# Altium schematic sheet BOARD_ADS _V2.0 (1).SchDoc
size A3; SheetNumber: 1; SheetTotal: 1
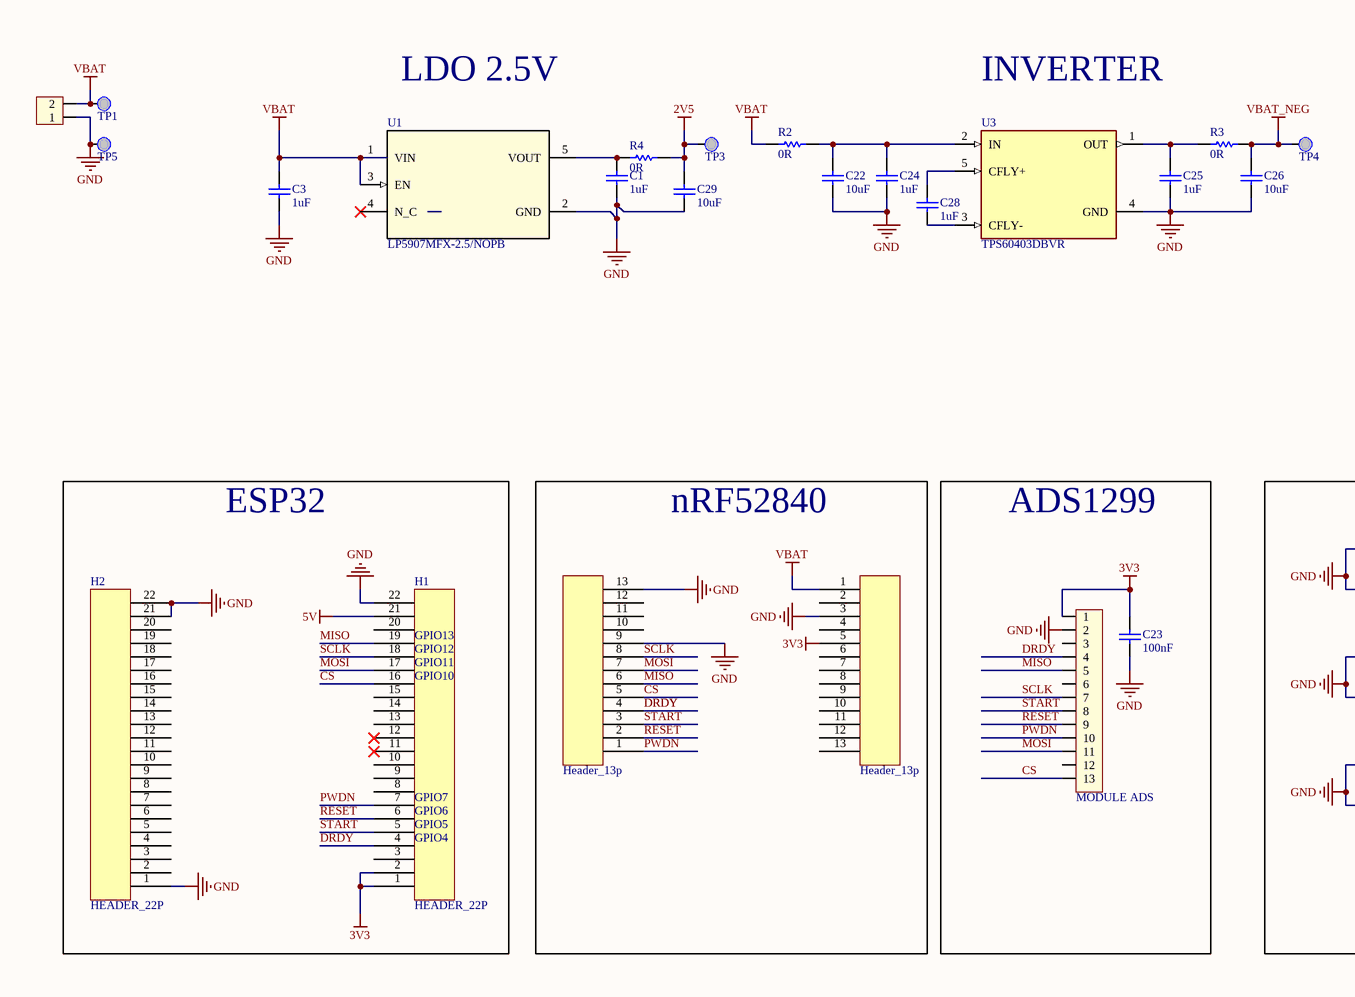
[diagram p0: BOARD_ADS _V2.0 (1).SchDoc, left]
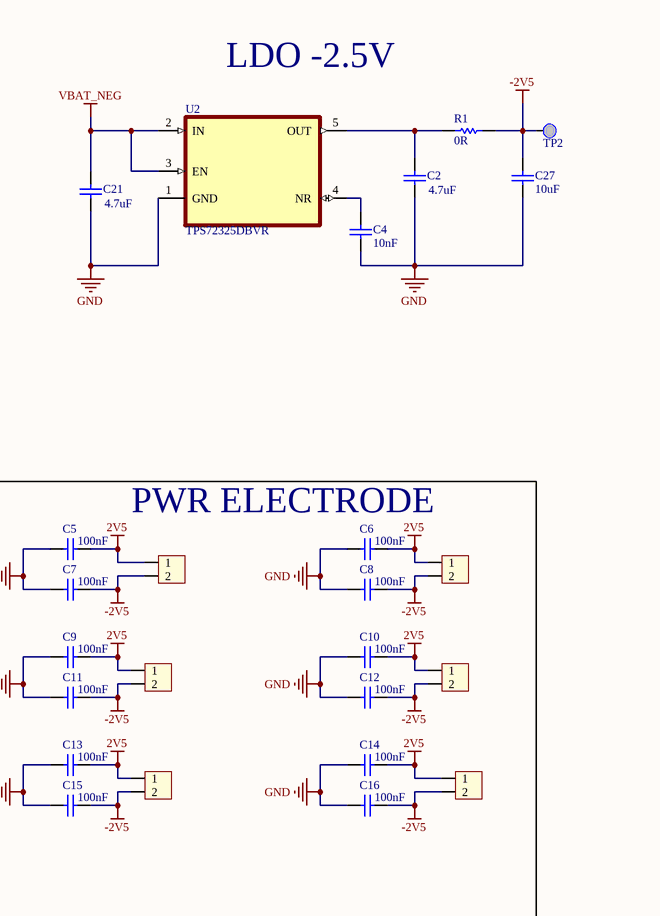
[diagram p1: BOARD_ADS _V2.0 (1).SchDoc, middle]

## Parts
C1  1uF  [C0805L]
C2  4.7uF  [C0805L]
C3  1uF  [C0805L]
C4  10nF  [C0805L]
C5  100nF  [C0402L]
C6  100nF  [C0402L]
C7  100nF  [C0402L]
C8  100nF  [C0402L]
C9  100nF  [C0402L]
C10  100nF  [C0402L]
C11  100nF  [C0402L]
C12  100nF  [C0402L]
C13  100nF  [C0402L]
C14  100nF  [C0402L]
C15  100nF  [C0402L]
C16  100nF  [C0402L]
C21  4.7uF  [C0805L]
C22  10uF  [C0805L]
C23  100nF  [C0805L]
C24  1uF  [C0805L]
C25  1uF  [C0805L]
C26  10uF  [C0805L]
C27  10uF  [C0805L]
C28  1uF  [C0805L]
C29  10uF  [C0805L]
H1  HEADER_22P  [header_22p]
H2  HEADER_22P  [header_22p]
H3  Header_13p  [HEADER_13P]
H4  MODULE ADS  [MODULE ADS1299]
H5  Header_13p  [HEADER_13P]
H6  Header 2P 2.54 Duc Thang  [XH2.54M-2]  (value not drawn)
H7  Header 2P 2.54 Duc Thang  [XH2.54M-2]  (value not drawn)
H8  Header 2P 2.54 Duc Thang  [XH2.54M-2]  (value not drawn)
H9  Header 2P 2.54 Duc Thang  [XH2.54M-2]  (value not drawn)
H10  Header 2P 2.54 Duc Thang  [XH2.54M-2]  (value not drawn)
H11  Header 2P 2.54 Duc Thang  [XH2.54M-2]  (value not drawn)
H12  Header 2P 2.54 Duc Thang  [XH2.54M-2]  (value not drawn)
R1  0R  [R0805]
R2  0R  [R0805]
R3  0R  [R0805]
R4  0R  [R0805]
TP1  TP_?  [TP_SMD_1P50]  (value not drawn)
TP2  TP_?  [TP_SMD_1P50]  (value not drawn)
TP3  TP_?  [TP_SMD_1P50]  (value not drawn)
TP4  TP_?  [TP_SMD_1P50]  (value not drawn)
TP5  TP_?  [TP_SMD_1P50]  (value not drawn)
U1  LP5907MFX-2.5/NOPB  [DBV0005A_M]
U2  TPS72325DBVR  [SOT95P280X145-5N]
U3  TPS60403DBVR  [SOT95P280X145-5N]

## Blocks framed on the sheet
ESP32: H1 H2
nRF52840: H3 H5
ADS1299: C23 H4
PWR ELECTRODE: C5-C16 H7-H12

## Nets
2V5: C5.2 C6.2 C9.2 C10.2 C13.2 C14.2 C29.1 H7.1 H8.1 H9.1 H10.1 H11.1 H12.1 R4.2 TP3.1(TP)
3V3: C23.1 H1.1 H1.2 H4.1 H5.5
5V: H1.21
-2V5: C7.2 C8.2 C11.2 C12.2 C15.2 C16.2 C27.1 H7.2 H8.2 H9.2 H10.2 H11.2 H12.2 R1.2 TP2.1(TP)
GND: C1.2 C2.2 C3.2 C4.2 C5.1 C6.1 C7.1 C8.1 C9.1 C10.1 C11.1 C12.1 C13.1 C14.1 C15.1 C16.1 C21.2 C22.2 C23.2 C24.2 C25.2 C26.2 C27.2 C29.2 H1.22 H2.1 H2.21 H2.22 H3.9 H3.13 H4.2 H5.3 H6.1 TP5.1(TP) U1.2(GND) U2.1(GND) U3.4(GND)
VBAT: C3.1 H5.1 H6.2 R2.1 TP1.1(TP) U1.1(VIN) U1.3(EN)
VBAT_NEG: C21.1 C26.1 R3.2 TP4.1(TP) U2.2(IN) U2.3(EN)
CS: H1.16 H3.5 H4.13
DRDY: H1.4 H3.4 H4.4
MISO: H1.19 H3.6 H4.5
MOSI: H1.17 H3.7 H4.11
PWDN: H1.7 H3.1 H4.10
RESET: H1.6 H3.2 H4.9
SCLK: H1.18 H3.8 H4.7
START: H1.5 H3.3 H4.8
NetC1_1: C1.1 R4.1 U1.5(VOUT)
NetC2_1: C2.1 R1.1 U2.5(OUT)
NetC4_1: C4.1 U2.4(NR)
NetC22_1: C22.1 C24.1 R2.2 U3.2(IN)
NetC25_1: C25.1 R3.1 U3.1(OUT)
NetC28_1: C28.1 U3.5(CFLY+)
NetC28_2: C28.2 U3.3(CFLY-)

Not connected (* = marked no-connect by the designer): H1 3 8 9 10 11* 12* 13 14 15 20; H2 2 3 4 5 6 7 8 9 10 11 12 13 14 15 16 17 18 19 20; H3 10 11 12; H4 3 6 12; H5 2 4 6 7 8 9 10 11 12 13; U1 4(N_C)*

## Notes on the sheet
- LDO 2.5V
- INVERTER
- LDO -2.5V
- (near H1) GPIO13
- (near H1) GPIO10
- (near H1) GPIO11
- (near H1) GPIO12
- (near H1) GPIO4
- (near H1) GPIO5
- (near H1) GPIO6
- (near H1) GPIO7

## Library data of the parts
C1-C16 C21-C29 = C0805: CAP 0402 MLCC NON-POLARIZED GENERIC; VALUE TOLERANCE VOLTAGE AND MPN SET ON INSTANCE; Type: Capacitor; Value2: SET_VOLTAGE; Case: 0402; Package: 0402
H4 = MODULE_ADS: Cắm; Ten_Linh_Kien: Header 10P XH2.54-10P Đực Cong; Don_Vi: Con; Ma_Hang: MH007094; Chung_Loai: Cắm
H6-H12 = Header 2P 2.54 Duc Thang: Cắm; Ten_Linh_Kien: Header 2P XH2.54-2P Đực Thẳng; Don_Vi: Con; Ma_Hang: MH001283; Chung_Loai: Cắm
R1-R4 = R0805: RES 0805 GENERIC; VALUE TOLERANCE POWER AND MPN SET ON INSTANCE; Value1: SET_VALUE; Case: 0805; Type: Resistor; Package: 0805
TP1-TP5 = TEST_POINT: TP SMD 1P PadDia_1.50mm ROUND COPPER TEST POINT
U1 = LP5907MFX-2.5NOPB: 250-mA, low-noise, high-PSRR, ultra-low-dropout voltage regulator with low IQ and enable 5-SOT-23 -40 to 125; Manufacturer_Name: Texas Instruments; TYPE: TYPE; RefDes: RefDes; Copyright: Copyright (C) 2026 Ultra Librarian. All rights reserved.; Manufacturer_Part_Number: LP5907MFX-2.5/NOPB
U2 = TPS72325DBVR: 200-mA, negative, adjustable low-dropout voltage regulator with enable; MF: Texas Instruments; SnapEDA_Link: https://www.snapeda.com/parts/TPS72325DBVR/Texas+Instruments/view-part/?ref=snap; Package: SOT-23-5 Texas Instruments; Value: *; MP: TPS72325DBVR; Check_prices: https://www.snapeda.com/parts/TPS72325DBVR/Texas+Instruments/view-part/?ref=eda
U3 = TPS60403DBVR: 60mA Charge Pump Voltage Inverter with Fixed 250kHz Operation; MF: Texas Instruments; SnapEDA_Link: https://www.snapeda.com/parts/TPS60403DBVR/Texas+Instruments/view-part/?ref=snap; Package: SOT-23-5 Texas Instruments; Value: *; MP: TPS60403DBVR; Check_prices: https://www.snapeda.com/parts/TPS60403DBVR/Texas+Instruments/view-part/?ref=eda